# EasyEDA Pro project ProPrj_RLY-1_2025-04-08.epro, schematic Schematic_3

## Sheets
1 P1: Board Name: Board_3; Create Date: 2025-04-08; Page Name: P1; Project Name: RLY-1; Schematic Name: Schematic_3; Update Date: 2025-04-08; Company: EasyEDA.com; Drawed: EasyEDA Pro; Drawn: EasyEDA; Page Size: A3; Part Number: JLCPCB-001; Reviewed: EasyEDA Pro; Version: V0.1
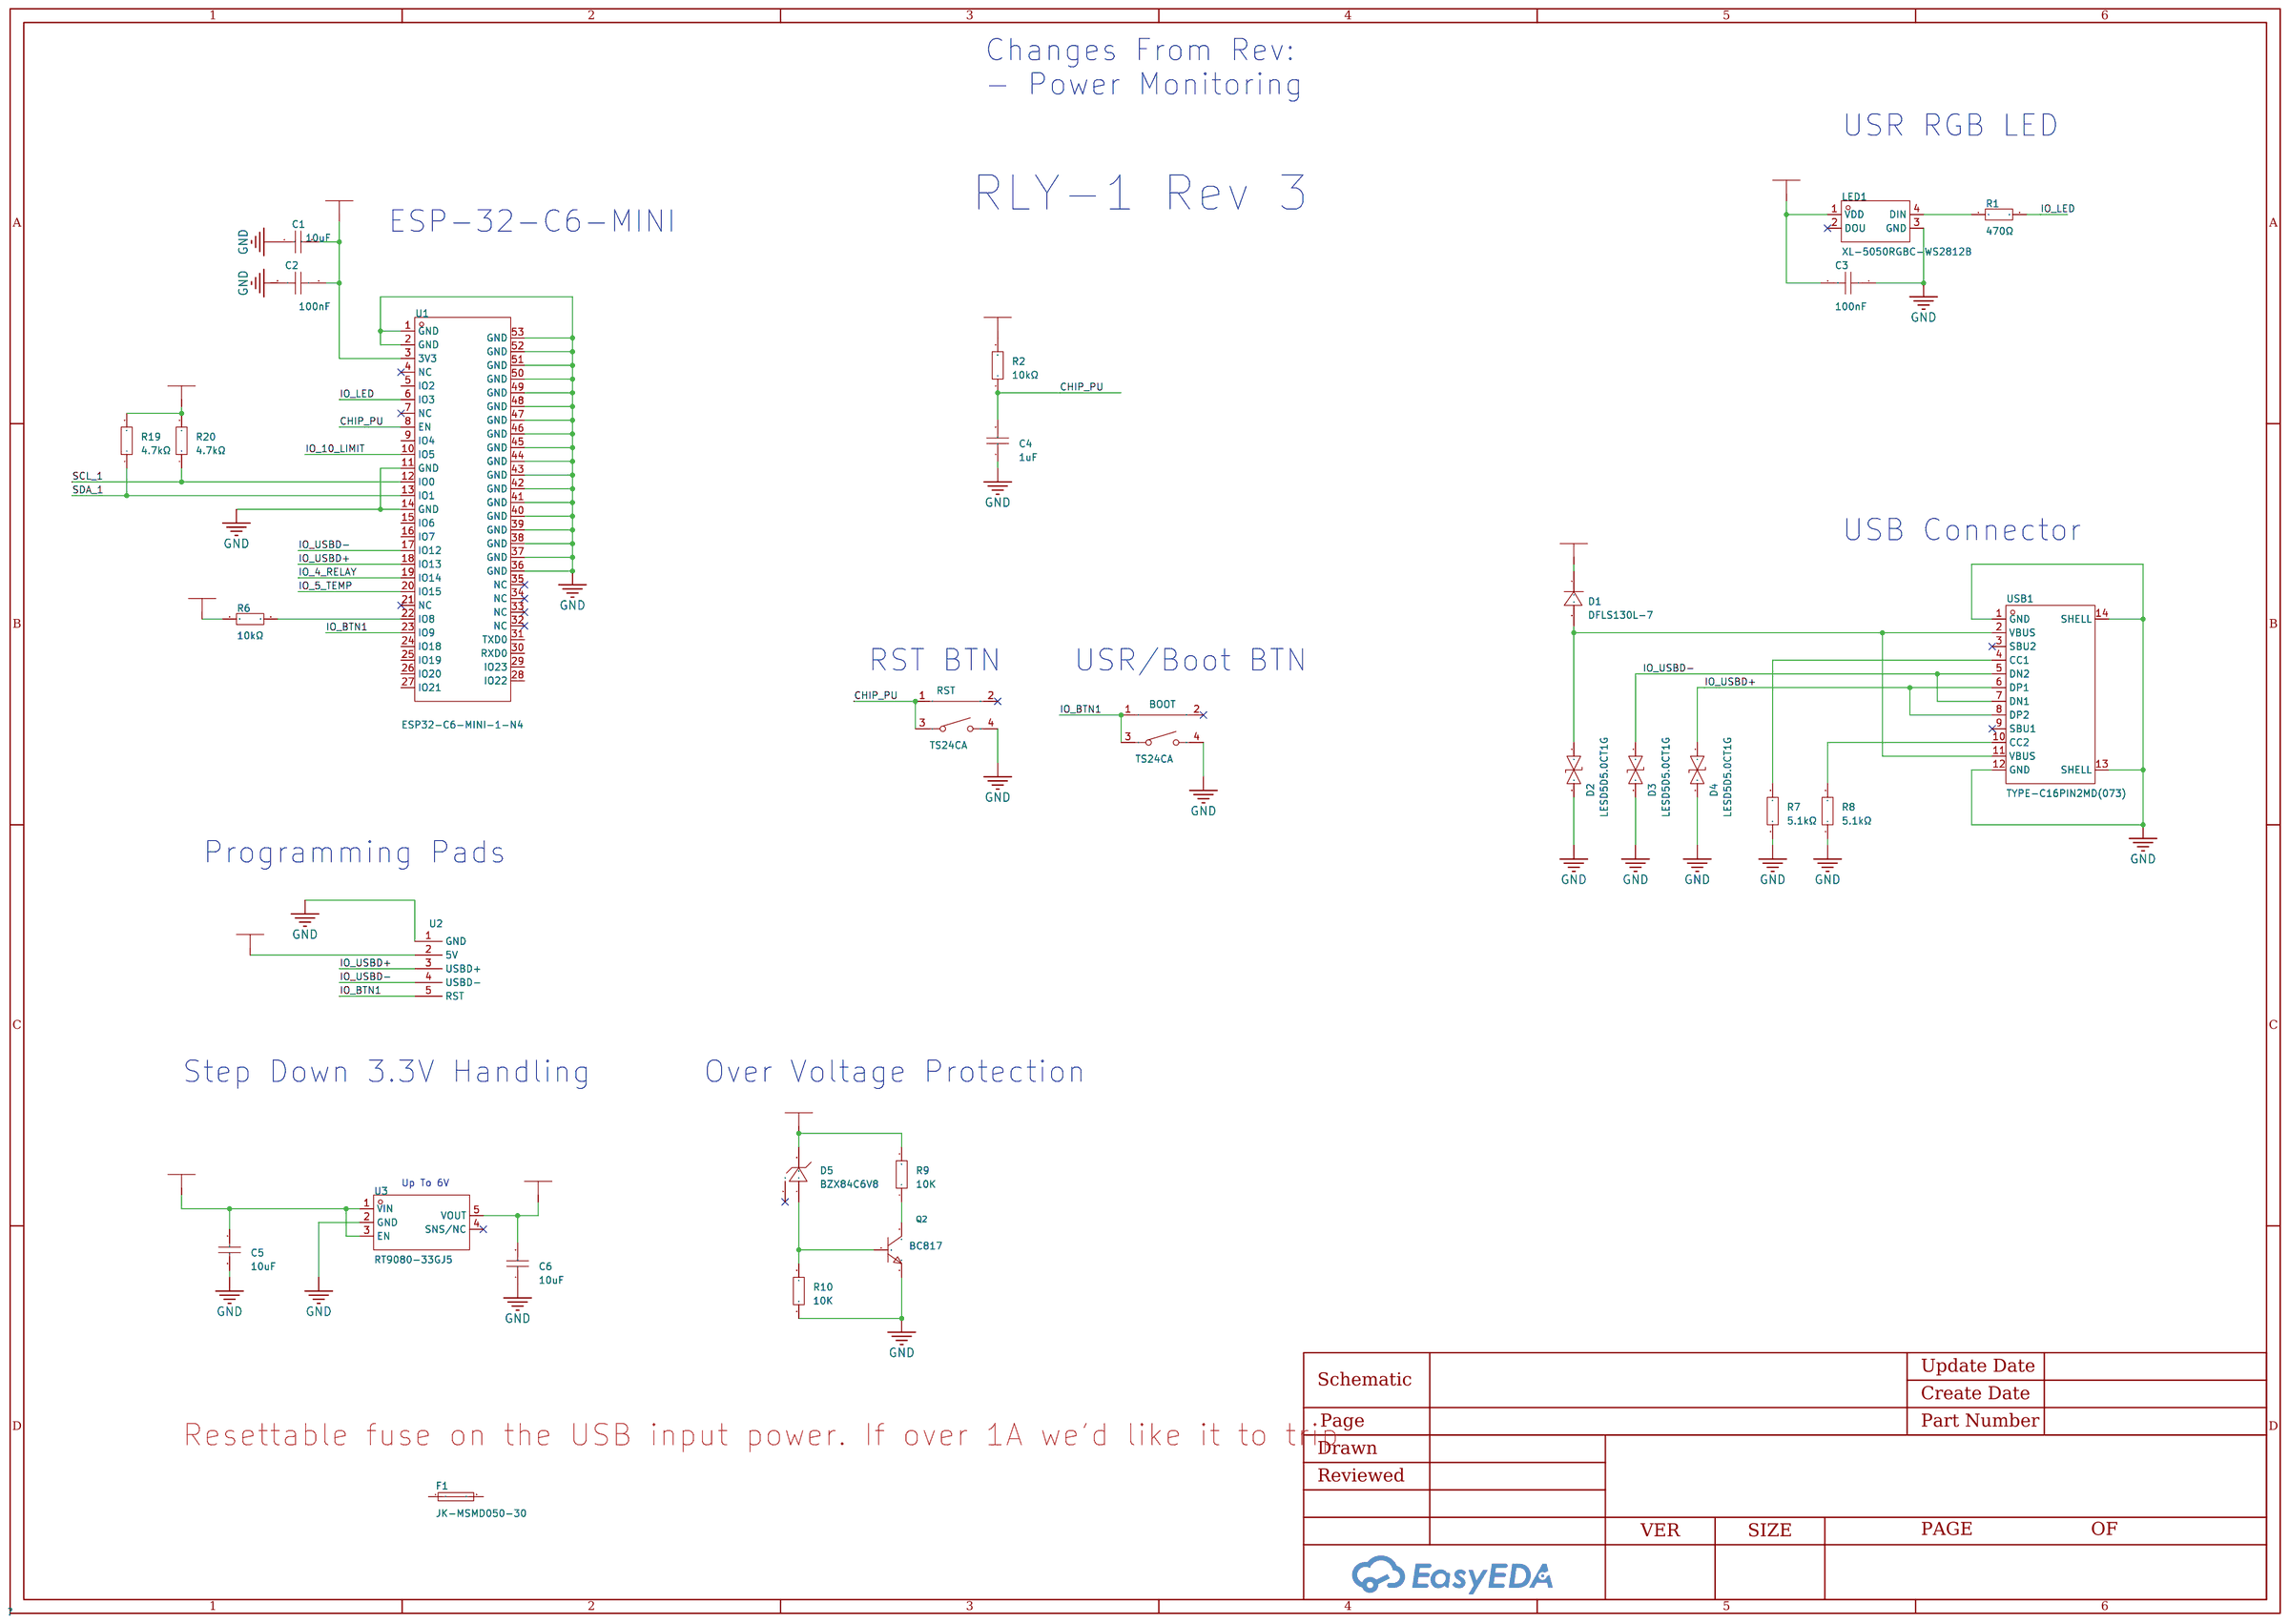
[diagram p4: P1]
2 P2: Create Date: 2025-04-07; Page Name: P2; Update Date: 2025-04-07
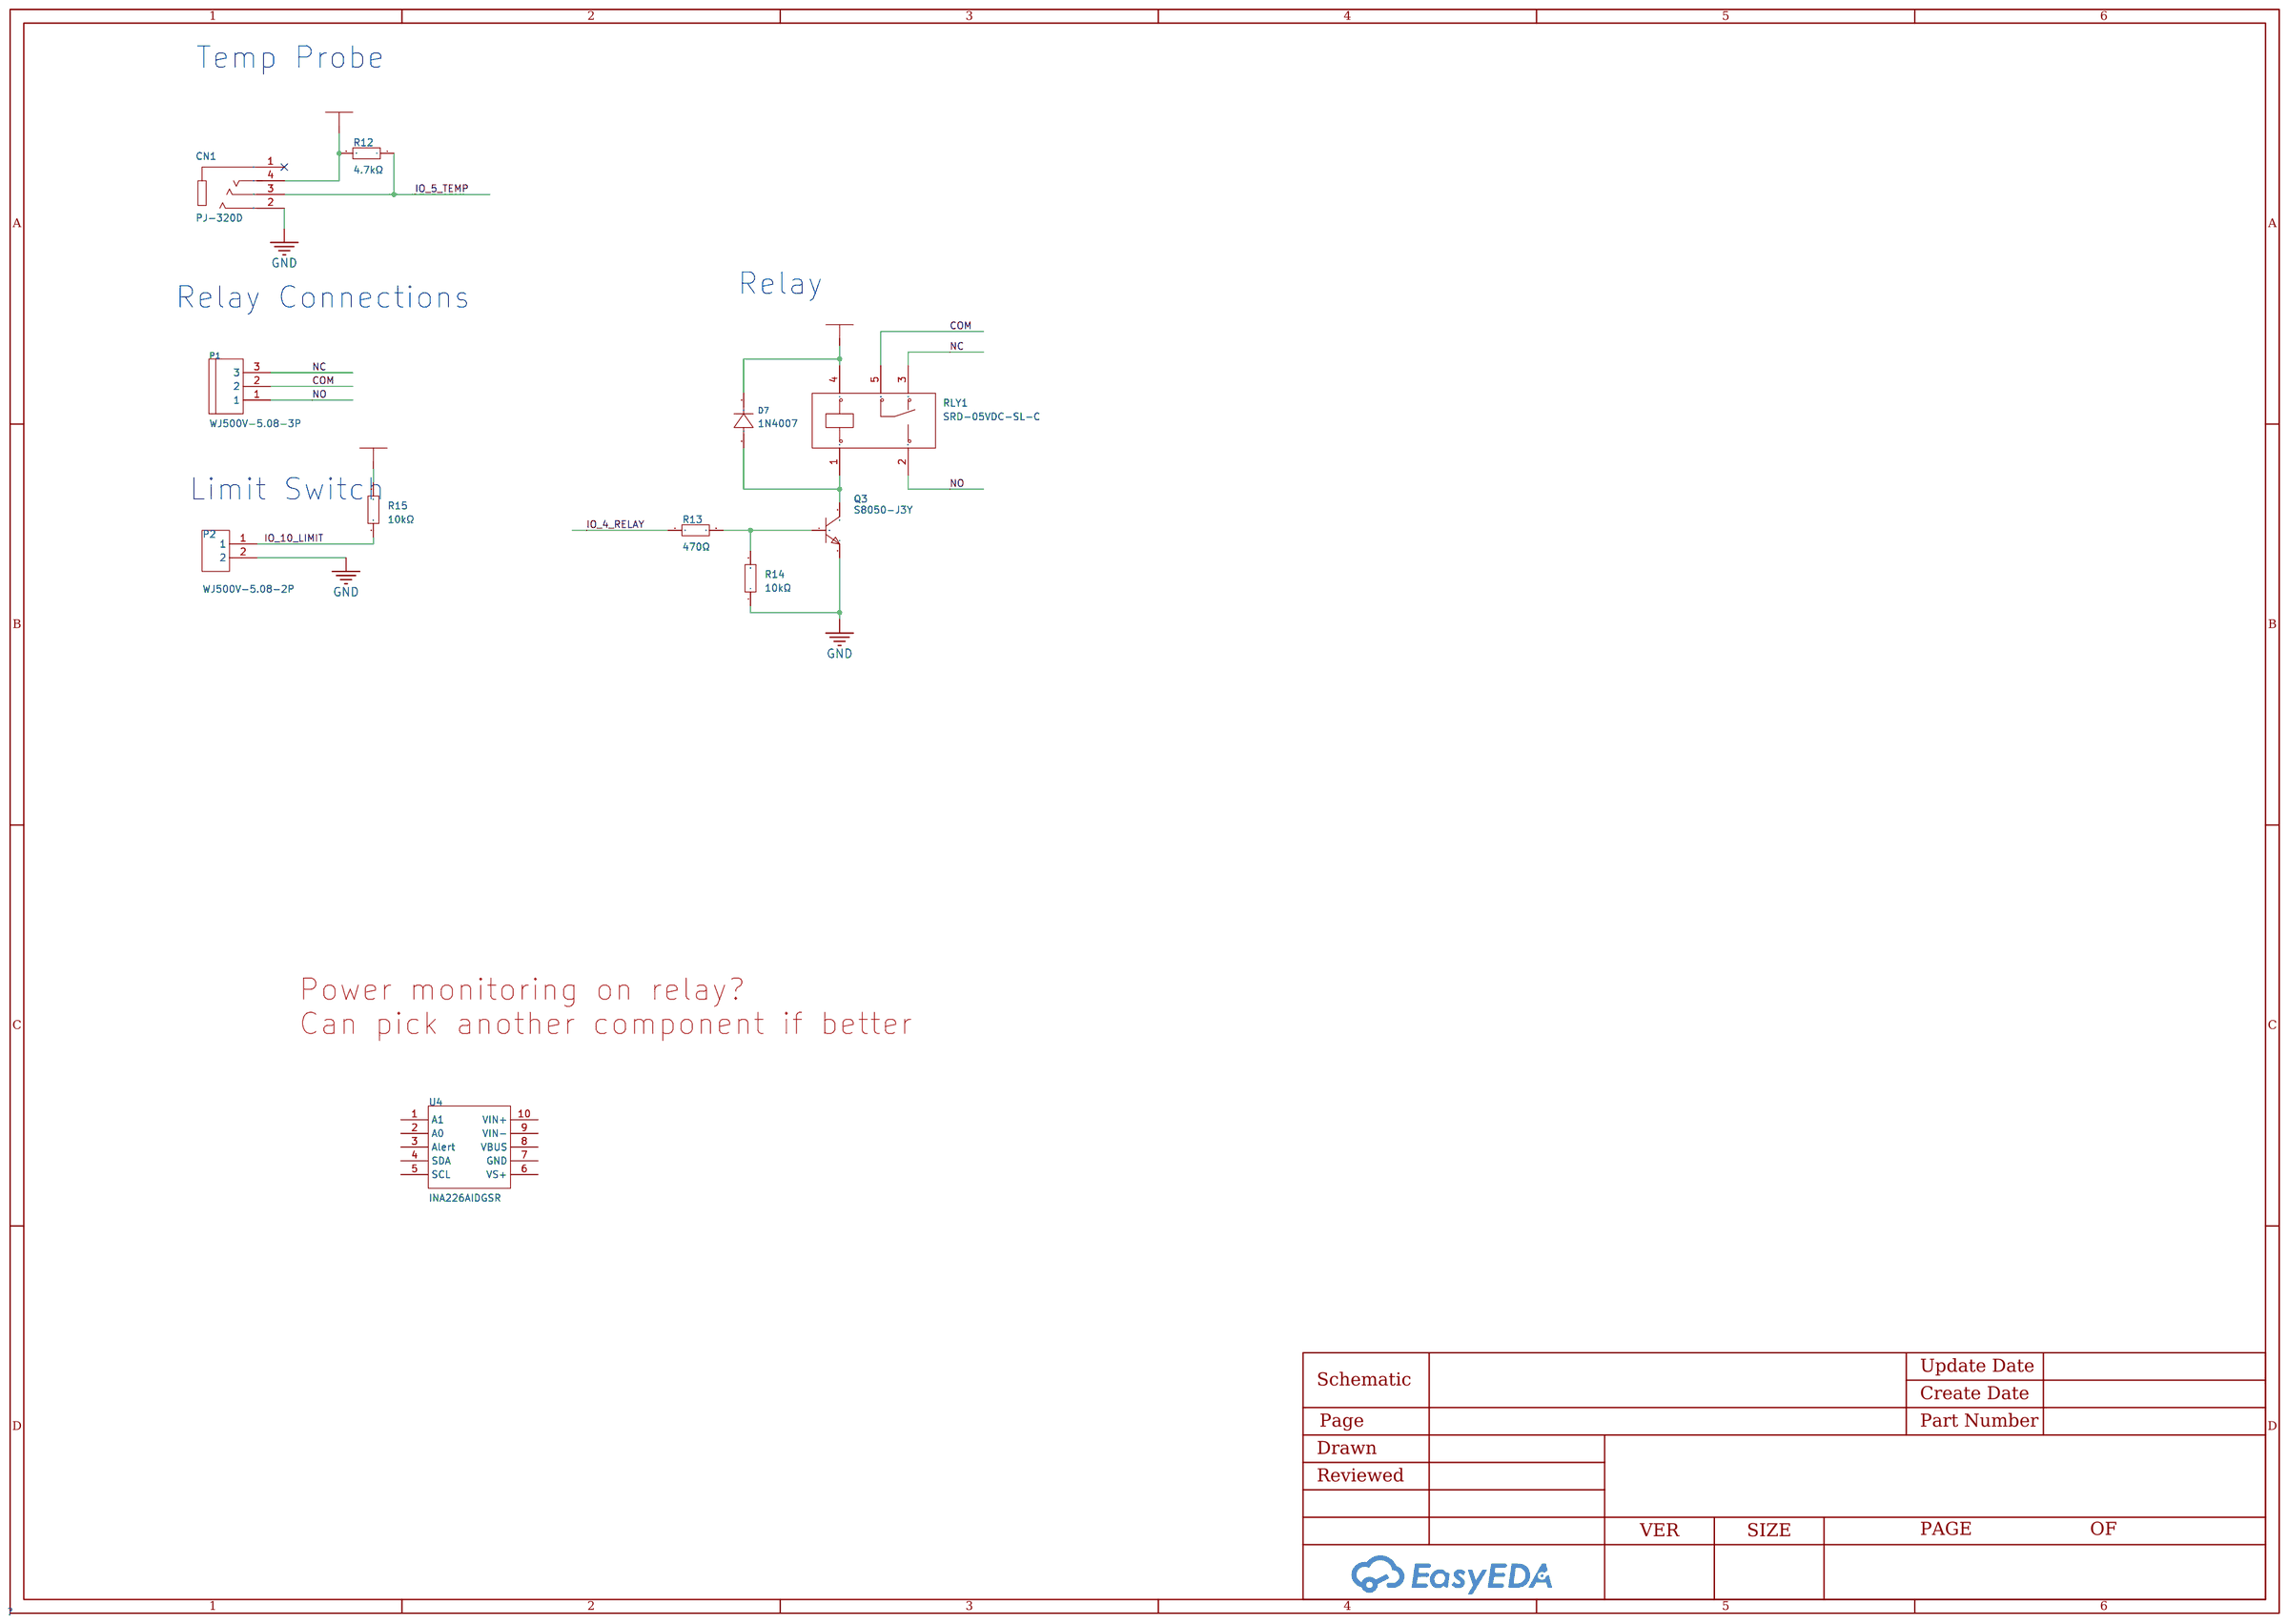
[diagram p5: P2]

## Parts
sheet P1
BOOT  TS24CA  [SW-SMD_TS24CA]
C1  10uF  [C0402]
C2  100nF  [C0402]
C3  100nF  [C0402]
C4  1uF  [C0402]
C5  10uF  [C0402]
C6  10uF  [C0402]
D1  DFLS130L-7  [POWERDI-123_L2.8-W1.8-LS3.7-RD]
D2  LESD5D5.0CT1G  [SOD-523_L1.2-W0.8-LS1.6-BI]
D3  LESD5D5.0CT1G  [SOD-523_L1.2-W0.8-LS1.6-BI]
D4  LESD5D5.0CT1G  [SOD-523_L1.2-W0.8-LS1.6-BI]
D5  BZX84C6V8  [SOT-23_L2.9-W1.3-P1.90-LS2.4-BR]
F1  JK-MSMD050-30  [F1812]
LED1  XL-5050RGBC-WS2812B  [LED-SMD_4P-L5.0-W5.0-BL_XL-5050RGBC]
Q2  BC817  [SOT-23-3_L2.9-W1.4-P1.91-LS2.6-BR]
R1  470Ω  [R0402]
R2  10kΩ  [R0402]
R6  10kΩ  [R0402]
R7  5.1kΩ  [R0402]
R8  5.1kΩ  [R0402]
R9  10K  [R0603]
R10  10K  [R0603]
R19  4.7kΩ  [R0402]
R20  4.7kΩ  [R0402]
RST  TS24CA  [SW-SMD_TS24CA]
U1  ESP32-C6-MINI-1-N4  [WIFIM-SMD_61P-L16.6-W13.2-P0.80-ESP32-C6-MINI-1-N4]
U2  -  [Programming Pads]
U3  RT9080-33GJ5  [TSOT-23-5_L2.9-W1.6-P0.95-LS2.8-BL]
USB1  TYPE-C16PIN2MD(073)  [USB-C-SMD_TYPE-C-6PIN-2MD-073]
sheet P2
CN1  PJ-320D  [AUDIO-SMD_PJ-320D]
D7  1N4007  [SMA_L4.3-W2.5-LS5.0-RD]
P1  WJ500V-5.08-3P  [CONN-TH_3P-P5.00_WJ500V-5.08-3P]
P2  WJ500V-5.08-2P  [CONN-TH_2P-P5.00_WJ500V-5.08-2P]
Q3  S8050-J3Y  [SOT-23-3_L2.9-W1.6-P1.90-LS2.8-BR]
R12  4.7kΩ  [R0402]
R13  470Ω  [R0402]
R14  10kΩ  [R0402]
R15  10kΩ  [R0402]
RLY1  SRD-05VDC-SL-C  [RELAY-TH_SRD-XXVDC-XL-C]
U4  INA226AIDGSR  [MSOP-10_L3.0-W3.0-P0.50-LS5.0-BL]

## Library data of the parts
BOOT RST = TS24CA: Contact Current:50mA Voltage Rating (DC):12V Circuit:SPST Mounting Style:Surface Mount Actuator Style:Rectangle button With Lamp:- Mechanical Life:- Switch Length:4.55mm Switch Width:1.8mm Switch Height:3.5mm; LCSC Part Name: 4.55*1.8*3.5mm卧贴轻触开关; Supplier Part: C393942; Manufacturer: SHOUHAN(首韩); Supplier Footprint: SMD; JLCPCB Part Class: ExtendedPart; Datasheet: https://atta.szlcsc.com/upload/public/pdf/source/20190521/C393942_591A9E318887EFA4274D34029981AD99.pdf; Supplier: LCSC; Contact Current: 50mA; Voltage Rating (DC): 12V; Circuit: SPST; Mounting Style: SurfaceMount; Actuator Style: Rectanglebutton; Switch Length: 4.55mm; Switch Width: 1.8mm; Switch Height: 3.5mm
C1 C5 C6 = CL05A106MQ5NUNC: Capacitance: Tolerance:±20% Tolerance:±20% Voltage Rated: Temperature Coefficient:; LCSC Part Name: 10uF ±20% 6.3V; Supplier Part: C15525; Manufacturer: SAMSUNG(三星); Supplier Footprint: 0402; JLCPCB Part Class: Basic Part; Datasheet: https://atta.szlcsc.com/upload/public/pdf/source/20220823/2B02EE04F8F211D38A52DCB16EB6BEBA.pdf; Supplier: LCSC; Tolerance: ±20%
C2 C3 = CL05B104KO5NNNC: Capacitance: Tolerance:±10% Tolerance:±10% Voltage Rated: Temperature Coefficient:; LCSC Part Name: 100nF ±10% 16V; Supplier Part: C1525; Manufacturer: SAMSUNG(三星); Supplier Footprint: 0402; JLCPCB Part Class: Basic Part; Datasheet: https://atta.szlcsc.com/upload/public/pdf/source/20160218/1457707763339.pdf; Supplier: LCSC; Tolerance: ±10%
C4 = CL05A105KP5NNNC: Capacitance: Tolerance:±10% Tolerance:±10% Voltage Rated: Temperature Coefficient:; LCSC Part Name: 1uF ±10% 10V; Supplier Part: C14445; Manufacturer: SAMSUNG(三星); Supplier Footprint: 0402; JLCPCB Part Class: Extended Part; Datasheet: https://atta.szlcsc.com/upload/public/pdf/source/20160218/1457707763339.pdf; Supplier: LCSC; Tolerance: ±10%
D1 = DFLS130L-7: Forward Voltage (Vf@If):310mV@1A Reverse Voltage (Vr):30V Average Rectified Current (Io):1A; LCSC Part Name: 电压:30V 电流:1A; Supplier Part: C110493; Manufacturer: DIODES(美台); Supplier Footprint: Power-DI-123; JLCPCB Part Class: Extended Part; Datasheet: https://atta.szlcsc.com/upload/public/pdf/source/20170427/1493286393645.pdf; Supplier: LCSC; Forward Voltage (Vf@If): 310mV@1A; Reverse Voltage (Vr): 30V; Average Rectified Current (Io): 1A
D2-D4 = LESD5D5.0CT1G: Polarity:Bi-Directional Reverse Stand-Off Voltage (Vrwm):5V Breakdown Voltage (VBR):5.6V Peak Pulse Current(Ipp)@8/20us:9.4A Clamping Voltage@Ipp:18.6V; LCSC Part Name: 双向ESD; Supplier Part: C383211; Manufacturer: LRC(乐山无线电); Supplier Footprint: SOD-523; JLCPCB Part Class: ExtendedPart; Datasheet: https://atta.szlcsc.com/upload/public/pdf/source/20190807/C383211_633DF4B4E2C161403226E5235FE33A1C.pdf; Supplier: LCSC; Polarity: Bi-Directional; Reverse Stand-Off Voltage (Vrwm): 5V; Breakdown Voltage (VBR): 5.6V; Peak Pulse Current(Ipp)@8/20us: 9.4A; Clamping Voltage@Ipp: 18.6V
D5 = BZX84C6V8_C118571: Diode Configuration:Single Zener Voltage (Nom):6.8V Reverse Leakage Current (Ir):2uA@4V Zener Voltage (Range):6.4V~7.2V Zener Voltage (Range):6.4V~7.2V Power Dissipation:350mW Zener Impedance (Zzt):15Ω Tolerance:- Tolerance:-; Supplier Part: C118571; Manufacturer: ST(先科); Supplier Footprint: SOT-23; JLCPCB Part Class: Extended Part; Datasheet: https://atta.szlcsc.com/upload/public/pdf/source/20170719/C118596_1500457750670828303.pdf; Supplier: LCSC; Diode Configuration: Single; Zener Voltage (Nom): 6.8V; Reverse Leakage Current (Ir): 2uA@4V; Zener Voltage (Range): 6.4V~7.2V; Power Dissipation: 350mW; Zener Impedance (Zzt): 15Ω
F1 = JK-MSMD050-30: Voltage - Max:30V Current - Max:100A Hold Current:500mA Trip Current:1A Time to Trip(Max):150ms; LCSC Part Name: 30V 500mA 1812自恢复; Supplier Part: C369168; Manufacturer: JK(金科); Supplier Footprint: 1812; Datasheet: https://atta.szlcsc.com/upload/public/pdf/source/20190306/C369179_49E64DF550FAABF10392FFAE74019A36.pdf; Supplier: LCSC; Voltage - Max: 30V; Current - Max: 100A; Hold Current: 500mA; Trip Current: 1A; Time to Trip(Max): 150ms
LED1 = XL-5050RGBC-WS2812B: Emitted Color:RGB Diode Configuration:- Lens Color:Colorless transparence Dominant Wavelength:- Dominant Wavelength:- Peak Wavelength:625nm；470nm；530nm Color Temperature:- Color Temperature:- Forward Current:- Power Dissipation:- Viewing Angle:120° Mounti; LCSC Part Name: RGB三色 正贴 幻彩; Supplier Part: C2843785; Manufacturer: XINGLIGHT(成兴光); Supplier Footprint: SMD5050; JLCPCB Part Class: Extended Part; Datasheet: https://atta.szlcsc.com/upload/public/pdf/source/20230111/86AAD2096485A2E5BCAB883FF8CBE6FD.pdf; Supplier: LCSC; Emitted Color: RGB; Lens Color: Colorless transparence; Peak Wavelength: 625nm；470nm；530nm; Viewing Angle: 120°; Mounting Sytle: Positive post; Operating Temperature: -30℃~+70℃
Q2 = BC817: Transistor Type: Collector Current (Ic): Collector-Emitter Breakdown Voltage (Vceo): Power Dissipation (Pd): Transition Frequency (fT):100MHz Collector Cut-Off Current (Icbo):100nA Collector-Emitter Saturation Voltage (VCE(sat)@Ic,Ib):700mV@500mA,50mA Ope; LCSC Part Name: NPN 电流:500mA 耐压:45V; Supplier Part: C466643; Manufacturer: High Diode(海德); Supplier Footprint: SOT-23; JLCPCB Part Class: 扩展库; Datasheet: https://atta.szlcsc.com/upload/public/pdf/source/20191203/C466643_48783E87EF98B3225D10B7DDEC5B406B.pdf; Supplier: LCSC; Transition Frequency (fT): 100MHz; Collector Cut-Off Current (Icbo): 100nA; Collector-Emitter Saturation Voltage (VCE(sat)@Ic,Ib): 700mV@500mA,50mA
R1 R13 = 0402WGF4700TCE: Resistance: Tolerance:±1% Tolerance:±1% Power(Watts): Overload Voltage (Max): Temperature Coefficient:±100ppm/℃ Temperature Coefficient:±100ppm/℃ Type:Thick Film Resistors Operating Temperature Range:-55℃~+155℃ Operating Temperature Range:-55℃~+155℃; LCSC Part Name: 470Ω ±1% 62.5mW 厚膜电阻; Supplier Part: C25117; Manufacturer: UNI-ROYAL(厚声); Supplier Footprint: 0402; JLCPCB Part Class: Basic Part; Datasheet: https://atta.szlcsc.com/upload/public/pdf/source/20200306/C422600_1E6D84923E4A46A82E41ADD87F860B5C.pdf; Supplier: LCSC; Tolerance: ±1%; Temperature Coefficient: ±100ppm/℃; Type: Thick Film Resistors; Operating Temperature Range: -55℃~+155℃
R2 R6 R14 R15 = 0402WGF1002TCE: Resistance:10000Ω Tolerance:±1% Tolerance:±1% Power(Watts): Overload Voltage (Max): Temperature Coefficient:±100ppm/℃ Temperature Coefficient:±100ppm/℃ Type:Thick Film Resistors Operating Temperature Range:-55℃~+155℃ Operating Temperature Range:-55℃~+155℃; LCSC Part Name: 10kΩ ±1% 62.5mW 厚膜电阻; Supplier Part: C25744; Manufacturer: UNI-ROYAL(厚声); Supplier Footprint: 0402; JLCPCB Part Class: Basic Part; Datasheet: https://atta.szlcsc.com/upload/public/pdf/source/20200306/C422600_1E6D84923E4A46A82E41ADD87F860B5C.pdf; Supplier: LCSC; Tolerance: ±1%; Temperature Coefficient: ±100ppm/℃; Type: Thick Film Resistors; Operating Temperature Range: -55℃~+155℃
R7 R8 = 0402WGF5101TCE: Type:Thick Film Resistors Resistance:5.1kΩ Tolerance:±1% Tolerance:±1% Power(Watts): Overload Voltage (Max): Temperature Coefficient:±100ppm/℃ Temperature Coefficient:±100ppm/℃ Operating Temperature Range:-55℃~+155℃ Operating Temperature Range:-55℃~+155℃; LCSC Part Name: 5.1kΩ ±1% 62.5mW 厚膜电阻; Supplier Part: C25905; Manufacturer: UNI-ROYAL(厚声); Supplier Footprint: 0402; JLCPCB Part Class: Basic Part; Datasheet: https://atta.szlcsc.com/upload/public/pdf/source/20200306/C422600_1E6D84923E4A46A82E41ADD87F860B5C.pdf; Supplier: LCSC; Tolerance: ±1%; Temperature Coefficient: ±100ppm/℃; Type: Thick Film Resistors; Operating Temperature Range: -55℃~+155℃
R9 R10 = Res_0603: Supplier Footprint: 0603
R12 R19 R20 = 0402WGF4701TCE: Resistance:4700Ω Tolerance:±1% Tolerance:±1% Power(Watts): Overload Voltage (Max): Temperature Coefficient:±100ppm/℃ Temperature Coefficient:±100ppm/℃ Type:Thick Film Resistors Operating Temperature Range:-55℃~+155℃ Operating Temperature Range:-55℃~+155℃; LCSC Part Name: 4.7kΩ ±1% 62.5mW 厚膜电阻; Supplier Part: C25900; Manufacturer: UNI-ROYAL(厚声); Supplier Footprint: 0402; JLCPCB Part Class: Basic Part; Datasheet: https://atta.szlcsc.com/upload/public/pdf/source/20200306/C422600_1E6D84923E4A46A82E41ADD87F860B5C.pdf; Supplier: LCSC; Tolerance: ±1%; Temperature Coefficient: ±100ppm/℃; Type: Thick Film Resistors; Operating Temperature Range: -55℃~+155℃
U1 = ESP32-C6-MINI-1-N4: Supplier Part: C5736265; Manufacturer: ESPRESSIF(乐鑫); Supplier Footprint: SMD-53P; JLCPCB Part Class: Extended Part; Datasheet: https://atta.szlcsc.com/upload/public/pdf/source/20240130/4529D418EFEC832950EB8101798FAED6.pdf; Supplier: LCSC
U2 = Programming Pad Comp
U3 = RT9080-33GJ5: Output Type:固定 Maximum Input Voltage:5.5V Output Voltage:3.3V Output Voltage:3.3V MAX Output Current:600mA Power Supply Rejection Ratio (PSRR):75dB@(1kHz) Dropout Voltage:530mV@(600mA) standby current:4uA Operating Temperature:-40℃~+85℃@(Ta) Operating Tem; Supplier Part: C841192; Manufacturer: RICHTEK(立锜); Supplier Footprint: TSOT-23-5; JLCPCB Part Class: Extended Part; Datasheet: https://atta.szlcsc.com/upload/public/pdf/source/20200918/C841192_D291BBB33AFC8816B317CCB22A728955.pdf; Supplier: LCSC; Output Type: 固定; Maximum Input Voltage: 5.5V; Output Voltage: 3.3V; MAX Output Current: 600mA; Power Supply Rejection Ratio (PSRR): 75dB@(1kHz); Dropout Voltage: 530mV@(600mA); standby current: 4uA; Operating Temperature: -40℃~+85℃@(Ta); Output Polarity: Positive electrode; Number of Outputs: 1
USB1 = TYPE-C 16PIN 2MD(073): Connector Type:Type-C Standard:- Gender:Female Number of Contacts:16 Number of Ports:1 Mounting Style:Surface Mount Current Rating - Power (Max):5A Operating Temperature Range:-25℃~+85℃ Operating Temperature Range:-25℃~+85℃; LCSC Part Name: TYPE-C母座16P4脚插件带定位柱不锈钢外壳2次模顶; Supplier Part: C2765186; Manufacturer: SHOUHAN(首韩); Supplier Footprint: SMD; JLCPCB Part Class: ExtendedPart; Supplier: LCSC; Connector Type: Type-C; Gender: Female; Number of Contacts: 16; Number of Ports: 1; Mounting Style: SurfaceMount; Current Rating - Power (Max): 5A; Operating Temperature Range: -25℃~+85℃
CN1 = PJ-320D_C431535: Connector Type:3.5mm耳机座 Current Rating (Max):300mA Voltage Rating (Max):50V Operating Temperature Range:-16℃~+65℃ Operating Temperature Range:-16℃~+65℃; LCSC Part Name: 3.5mm耳机座; Supplier Part: C431535; Manufacturer: SHOU HAN(首韩); Supplier Footprint: SMD; JLCPCB Part Class: Extended Part; Datasheet: https://atta.szlcsc.com/upload/public/pdf/source/20190925/C431535_8B274506621F6117FB020BF07A197848.pdf; Supplier: LCSC; Connector Type: 3.5mm耳机座; Current Rating (Max): 300mA; Voltage Rating (Max): 50V; Operating Temperature Range: -16℃~+65℃
D7 = 1N4007_C727081: Diode Configuration: Forward Voltage (Vf@If):1.1V@1A Reverse Voltage (Vr): Average Rectified Current (Io): Reverse Leakage Current:5uA@1kV; LCSC Part Name: 电压:1kV 电流:1A; Supplier Part: C727081; Manufacturer: TWGMC(台湾迪嘉); Supplier Footprint: SMA(DO-214AC); JLCPCB Part Class: Extended Part; Datasheet: https://atta.szlcsc.com/upload/public/pdf/source/20200828/C727079_3A05254382567072883400655AE0ED46.pdf; Supplier: LCSC; Forward Voltage (Vf@If): 1.1V@1A; Reverse Leakage Current: 5uA@1kV
P1 = WJ500V-5.08-3P: Structure:1x3P Pitch:5.08mm Color:Green Mounting Style:Straight Current Rating (Max):18A Voltage Rating (Max):250V Number of Pins:3P Number of Rows:1 Wire Gauge - AWG:14~30 Wire Gauge - AWG:14~30 Wire Gauge - mm2:2.5 Wire Gauge - mm2:2.5 Number of PINs Pe; LCSC Part Name: 5.08mm 1x3P 排数:1 每排P数:3 直插; Supplier Part: C72334; Manufacturer: KANGNEX(康奈克斯电气); Supplier Footprint: 插件,P=5.08mm; JLCPCB Part Class: Extended Part; Datasheet: https://atta.szlcsc.com/upload/public/pdf/source/20191225/C72334_8A5EF831D67650233B6B1E3F2BC06274.pdf; Supplier: LCSC; Structure: 1x3P; Pitch: 5.08mm; Color: Green; Mounting Style: Straight; Current Rating (Max): 18A; Voltage Rating (Max): 250V; Number of Pins: 3P; Number of Rows: 1; Wire Gauge - AWG: 14~30; Wire Gauge - mm2: 2.5; Number of PINs Per Row: 3; Operating Temperature Range: -40℃~+105℃
P2 = WJ500V-5.08-2P: Structure:1x2P Pitch:5.08mm Color:Green Mounting Style:Straight Current Rating (Max):18A Voltage Rating (Max):250V Number of Pins:2P Number of Rows:1 Wire Gauge - AWG:14~30 Wire Gauge - AWG:14~30 Wire Gauge - mm2:2.5 Wire Gauge - mm2:2.5 Number of PINs Pe; LCSC Part Name: 1x2P 5.08mm 直插 排数:1 每排P数:2; Supplier Part: C8465; Manufacturer: KANGNEX(康奈克斯电气); Supplier Footprint: 插件,P=5.08mm; JLCPCB Part Class: Extended Part; Datasheet: https://atta.szlcsc.com/upload/public/pdf/source/20191225/C8465_02D34CE5B5B4A53DF5891601D97FA9F4.pdf; Supplier: LCSC; Structure: 1x2P; Pitch: 5.08mm; Color: Green; Mounting Style: Straight; Current Rating (Max): 18A; Voltage Rating (Max): 250V; Number of Pins: 2P; Number of Rows: 1; Wire Gauge - AWG: 14~30; Wire Gauge - mm2: 2.5; Number of PINs Per Row: 2; Operating Temperature Range: -40℃~+105℃; Screw Specification: M2.5
Q3 = S8050-J3Y_C18221467: Transistor Type: Collector Current (Ic):- Collector-Emitter Breakdown Voltage (Vceo):- Power Dissipation (Pd):- DC Current Gain (hFE@Ic,Vce):- DC Current Gain (hFE@Ic,Vce):- Transition Frequency (fT):- Collector Cut-Off Current (Icbo):- Collector-Emitter; LCSC Part Name: NPN; Supplier Part: C18221467; Manufacturer: JSMSEMI(杰盛微); Supplier Footprint: SOT-23; JLCPCB Part Class: Extended Part; Datasheet: https://atta.szlcsc.com/upload/public/pdf/source/20231012/B1036D3E74EDF66F384E85A64ABC053C.pdf; Supplier: LCSC
RLY1 = SRD-05VDC-SL-C: Coil Voltage:5V Contact Form:一组转换:1C(SPDT-转换) Pin Number:5 Contact Rating:- Maximum Switching Voltage:250V@AC Coil Rated Power:360mW Maximum Switching Current:15A Coil Type:无极性-单线圈 Coil Resistance:70Ω Contact Resistance:100mΩ Operate Time:10ms Release Tim; LCSC Part Name: 蓝色; Supplier Part: C35449; Manufacturer: 松乐; Supplier Footprint: 插件,15.6x19.2mm; JLCPCB Part Class: Extended Part; Datasheet: https://atta.szlcsc.com/upload/public/pdf/source/20200305/C490149_C96E4098A3B1FFB377D5AD2E40B7C2A8.pdf; Supplier: LCSC; Coil Voltage: 5V; Contact Form: 一组转换:1C(SPDT-转换); Pin Number: 5; Maximum Switching Voltage: 250V@AC; Coil Rated Power: 360mW; Maximum Switching Current: 15A; Coil Type: 无极性-单线圈; Coil Resistance: 70Ω; Contact Resistance: 100mΩ; Operate Time: 10ms; Release Time: 10ms
U4 = INA226AIDGSR: Supply Voltage:0V~36V Supply Voltage:0V~36V Operating Temperature:-40℃~+125℃ Operating Temperature:-40℃~+125℃; Supplier Part: C49851; Manufacturer: TI(德州仪器); Supplier Footprint: MSOP-10; Datasheet: https://www.ti.com/cn/lit/gpn/ina226; Supplier: LCSC; Supply Voltage: 0V~36V; Operating Temperature: -40℃~+125℃

## Nets
+3V3: C1.2 C2.1 C6.2 CN1.4 R2.2 R6.2 R12.2 R15.2 R19.2 R20.2 U1.3(3V3) U3.5(VOUT)
+5V_USB: C3.2 C5.2 D1.1 D5.3(C) D7.1(K) LED1.1(VDD) R9.2 RLY1.4 U2.2(5V) U3.1(VIN) U3.3(EN)
GND: BOOT.4 C1.1 C2.2 C3.1 C4.1 C5.1 C6.1 CN1.2 D2.2 D3.2 D4.2 LED1.3(GND) P2.2 Q2.2(E) Q3.2(E) R7.1 R8.1 R10.1 R14.1 RST.4 U1.1(GND) U1.2(GND) U1.11(GND) U1.14(GND) U1.36(GND) U1.37(GND) U1.38(GND) U1.39(GND) U1.40(GND) U1.41(GND) U1.42(GND) U1.43(GND) U1.44(GND) U1.45(GND) U1.46(GND) U1.47(GND) U1.48(GND) U1.49(GND) U1.50(GND) U1.51(GND) U1.52(GND) U1.53(GND) U2.1(GND) U3.2(GND) USB1.1(GND) USB1.12(GND) USB1.13(SHELL) USB1.14(SHELL)
CHIP_PU: C4.2 R2.1 RST.1 RST.3 U1.8(EN)
COM: P1.2 RLY1.5
IO_4_RELAY: R13.1 U1.19(IO14)
IO_5_TEMP: CN1.3 R12.1 U1.20(IO15)
IO_10_LIMIT: P2.1 R15.1 U1.10(IO5)
IO_BTN1: BOOT.1 BOOT.3 U1.23(IO9) U2.5(RST)
IO_LED: R1.2 U1.6(IO3)
IO_USBD+: D4.1 U1.18(IO13) U2.3(USBD+) USB1.6(DP1) USB1.8(DP2)
IO_USBD-: D3.1 U1.17(IO12) U2.4(USBD-) USB1.5(DN2) USB1.7(DN1)
NC: P1.3 RLY1.3
NO: P1.1 RLY1.2
SCL_1: R20.1 U1.12(IO0)
SDA_1: R19.1 U1.13(IO1)
$1N1788: R7.2 USB1.4(CC1)
$1N1789: R8.2 USB1.10(CC2)
$1N1792: Q2.3(C) R9.1
$1N1794: D5.1(A) Q2.1(B) R10.2
$1N1815: R6.1 U1.22(IO8)
$1N1837: LED1.4(DIN) R1.1
$1N1854: D1.2 D2.1 USB1.2(VBUS) USB1.11(VBUS)
$2N930: Q3.1(B) R13.2 R14.2
$2N1031: D7.2(A) Q3.3(C) RLY1.1

Not connected (* = marked no-connect by the designer): BOOT 2*; CN1 1*; D5 2*; F1 1 2; LED1 2(DOU)*; RST 2*; U1 4(NC)* 5(IO2) 7(NC)* 9(IO4) 15(IO6) 16(IO7) 21(NC)* 24(IO18) 25(IO19) 26(IO20) 27(IO21) 28(IO22) 29(IO23) 30(RXD0) 31(TXD0) 32(NC)* 33(NC)* 34(NC)* 35(NC)*; U3 4(SNS/NC)*; U4 1(A1) 2(A0) 3(Alert) 4(SDA) 5(SCL) 6(VS+) 7(GND) 8(VBUS) 9(VIN-) 10(VIN+); USB1 3(SBU2)* 9(SBU1)*

## Notes on the sheets
sheet 1
- Changes From Rev:
  - Power Monitoring
- USR RGB LED
- RLY-1 Rev 3
- ESP-32-C6-MINI
- USB Connector
- RST BTN
- USR/Boot BTN
- Programming Pads
- Step Down 3.3V Handling
- Over Voltage Protection
- Up To 6V
- Resettable fuse on the USB input power. If over 1A we'd like it to trip
sheet 2
- Temp Probe
- Relay
- Relay Connections
- Limit Switch
- Power monitoring on relay?
  Can pick another component if better
